# EasyEDA Pro project EVA_RT.eprj, schematic USB_Converter
Board Name: #5_Convertidor; Create Date: 2025-01-23; Page Name: P1; Project Name: EVA_RT; Schematic Name: Convertidor; Update Date: 2025-01-23; Company: EasyEDA.com; Drawed: EasyEDA Pro; Page Size: A4; Part Number: JLCPCB-002; Reviewed: EasyEDA Pro; Version: V0.1
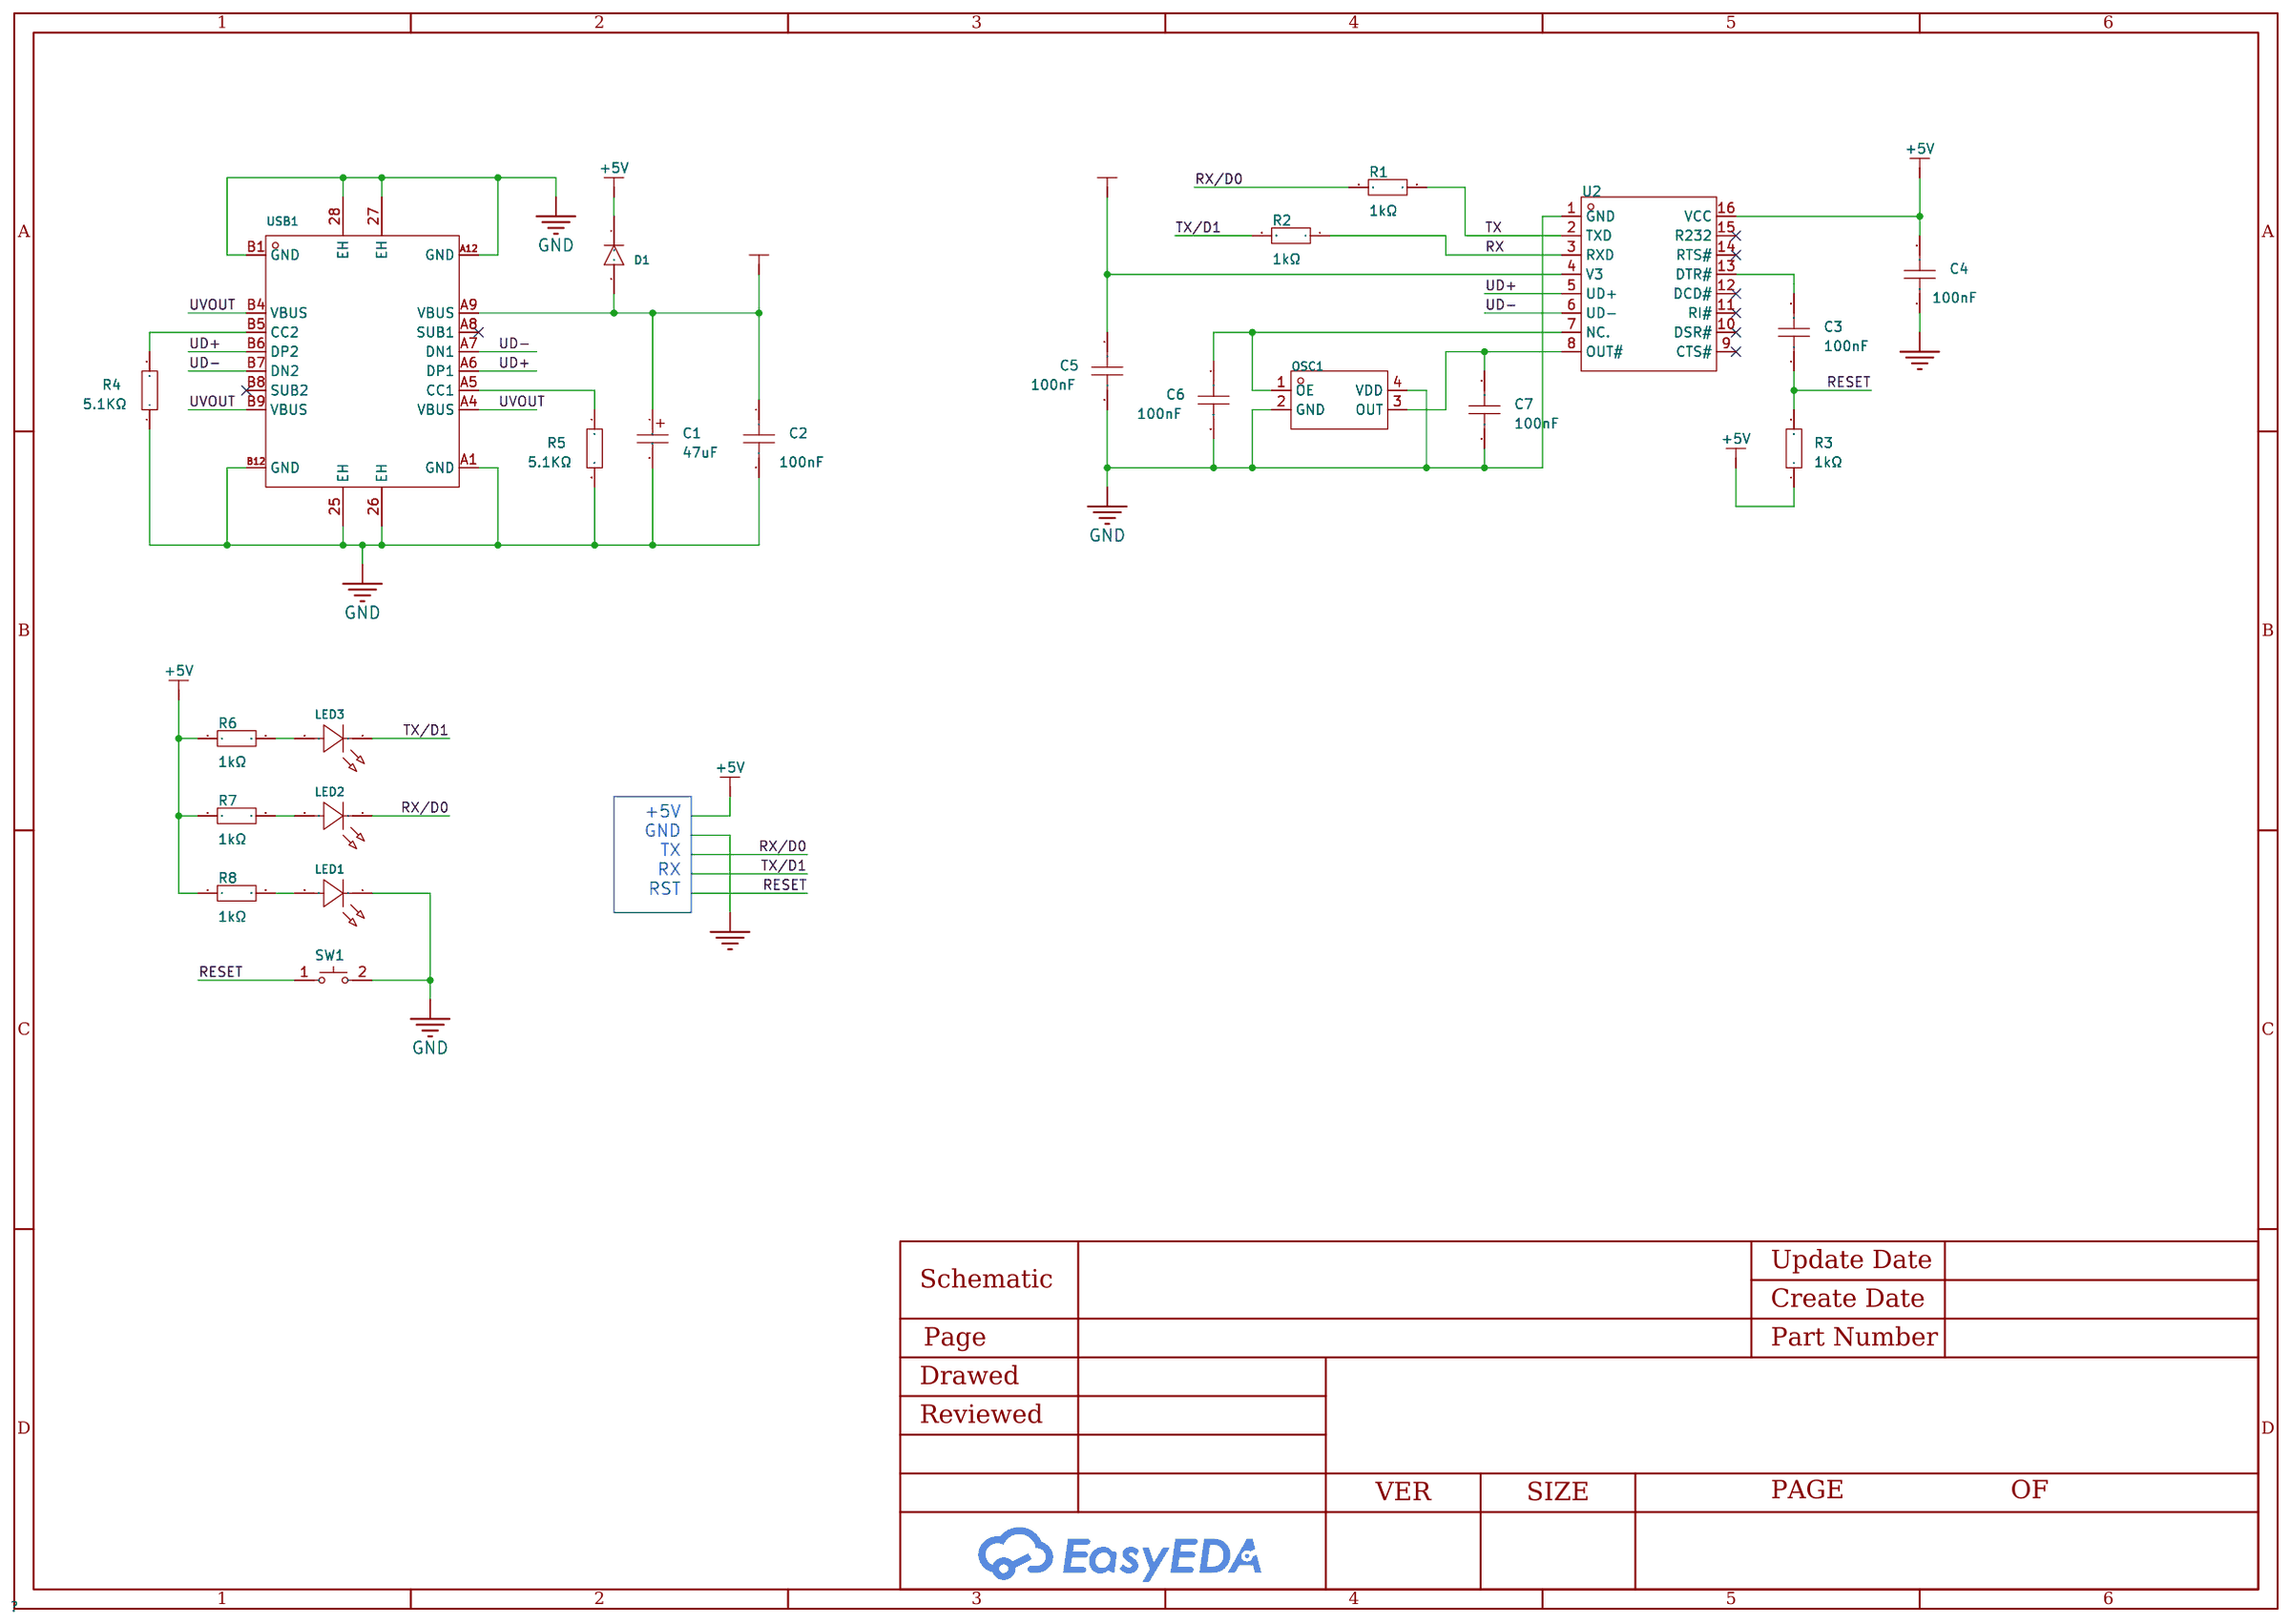
[diagram p1: schematic sheet]

## Parts
C1  47uF  [CAP-SMD_L3.2-W1.6-RD]
C2  100nF  [C0603]
C3  100nF  [C0603]
C4  100nF  [C0603]
C5  100nF  [C0603]
C6  100nF  [C0603]
C7  100nF  [C0603]
D1  SBR0560S1-7  [SOD-123_L2.7-W1.6-LS3.7-RD]
LED1  XL-1608SURC-06  [LED0603-RD_RED]
LED2  XL-1608SURC-06  [LED0603-RD_RED]
LED3  XL-1608SURC-06  [LED0603-RD_RED]
OSC1  DSC6001JI1A-012.0000  [OSC-SMD_4P-L2.5-W2.0-BL-A]
R1  1kΩ  [R0603]
R2  1kΩ  [R0603]
R3  1kΩ  [R0603]
R4  5.1KΩ  [R0603]
R5  5.1KΩ  [R0603]
R6  1kΩ  [R0603]
R7  1kΩ  [R0603]
R8  1kΩ  [R0603]
SW1  TS-1101A-C-R  [SW-SMD_L6.00-W3.60-LS6.0]
U2  CH340C  [SOP-16_L10.0-W3.9-P1.27-LS6.0-BL]
USB1  UB1611-HGN  [USB-C-SMD_GANGYUAN_UB1611-HGN]

## Library data of the parts
C1 = TC212A476K006Y: Capacitance: Tolerance:±10% Tolerance:±10% Rated Voltage: Equivalent Series Resistance(ESR):2.5Ω@100kHz Operating Temperature:-55℃~+125℃ Operating Temperature:-55℃~+125℃; LCSC Part Name: 47uF ±10% 6.3V; Supplier Part: C108525; Manufacturer: Sunlord(顺络); Supplier Footprint: CASE-A-3216; JLCPCB Part Class: Extended Part; Datasheet: https://atta.szlcsc.com/upload/public/pdf/source/20231030/DDA5D10C6B7FCAF98AC7C23C2BD0B0CB.pdf; Supplier: LCSC; Tolerance: ±10%; Equivalent Series Resistance(ESR): 2.5Ω@100kHz; Operating Temperature: -55℃~+125℃
C2-C7 = C1608NP01H101JT000N: Capacitance: Tolerance:±5% Tolerance:±5% Voltage Rated: Temperature Coefficient:; LCSC Part Name: 100pF ±5% 50V; Supplier Part: C343033; Manufacturer: TDK; Supplier Footprint: 0603; JLCPCB Part Class: Extended Part; Datasheet: https://atta.szlcsc.com/upload/public/pdf/source/20190311/C343033_2C1C068BC0A68B1F01ED28762004C2DC.pdf; Supplier: LCSC; Tolerance: ±5%
D1 = SBR0560S1-7: Diode Configuration: Forward Voltage (Vf) @ If:500mV@500mA Reverse Voltage (Vr): Average Rectified Current (Io): Reverse Leakage Current:100uA@60V; LCSC Part Name: 电压:60V 电流:500mA; Supplier Part: C117950; Manufacturer: DIODES(美台); Supplier Footprint: SOD-123; JLCPCB Part Class: Extended Part; Datasheet: https://atta.szlcsc.com/upload/public/pdf/source/20170919/C117950_1505787083539976730.pdf; Supplier: LCSC; Forward Voltage (Vf) @ If: 500mV@500mA; Reverse Leakage Current: 100uA@60V
LED1-LED3 = XL-1608SURC-06: Emitted Color:Red Power Dissipation:55mW Forward Current:25mA Dominant Wavelength:617nm~621nm Dominant Wavelength:617nm~621nm Peak Wavelength:623nm Lens Color:无色透明透镜 Color Temperature:- Color Temperature:- Viewing Angle:120° Mounting Sytle:Positive post O; Supplier Part: C965799; Manufacturer: XINGLIGHT(成兴光); Supplier Footprint: 0603; JLCPCB Part Class: Extended Part; Datasheet: https://atta.szlcsc.com/upload/public/pdf/source/20221102/D860AFDD1CDB02C5A8064103A32707E2.pdf; Supplier: LCSC; Emitted Color: Red; Power Dissipation: 55mW; Forward Current: 25mA; Dominant Wavelength: 617nm~621nm; Peak Wavelength: 623nm; Lens Color: 无色透明透镜; Viewing Angle: 120°; Mounting Sytle: Positive post; Operating Temperature: -30℃~+85℃
OSC1 = DSC6001JI1A-012.0000: Frequency Stability(Full temperature range):±50ppm Frequency Stability(Full temperature range):±50ppm Supply Voltage:1.71V~3.63V Supply Voltage:1.71V~3.63V; LCSC Part Name: ±50ppm 1.71V~3.63V; Supplier Part: C1670141; Manufacturer: MICROCHIP(美国微芯); Supplier Footprint: SMD2520-4P; JLCPCB Part Class: Extended Part; Datasheet: https://atta.szlcsc.com/upload/public/pdf/source/20220204/C2650861_191B97C70369EA2D8C3836A09455016A.pdf; Supplier: LCSC; Frequency Stability(Full temperature range): ±50ppm; Supply Voltage: 1.71V~3.63V
R1-R8 = RC0603FR-071KL: Type:Thick Film Resistors Resistance: Tolerance:±1% Tolerance:±1% Power(Watts): Overload Voltage (Max): Temperature Coefficient:±100ppm/℃ Temperature Coefficient:±100ppm/℃ Operating Temperature Range:-55℃~+155℃ Operating Temperature Range:-55℃~+155℃; LCSC Part Name: 厚膜电阻 1kΩ ±1% 100mW; Supplier Part: C22548; Manufacturer: YAGEO(国巨); Supplier Footprint: 0603; JLCPCB Part Class: Extended Part; Datasheet: https://atta.szlcsc.com/upload/public/pdf/source/20180316/70C0E2BDAE7FCC62C531A5A58D202EE1.pdf; Supplier: LCSC; Type: Thick Film Resistors; Tolerance: ±1%; Temperature Coefficient: ±100ppm/℃; Operating Temperature Range: -55℃~+155℃
SW1 = TS-1101A-C-R: Circuit:SPST Actuator Style:Rectangle button Operating Force:260gf Mounting Style:Standing paste Switch Length:6mm Switch Width:3.6mm Switch Height:2.5mm Strike Gundam:Without Contact Current:50mA Voltage Rating (DC):12V Insulation Resistance:- Actuator/C; LCSC Part Name: 6*3.6*2.5mm 立贴 轻触开关; Supplier Part: C388638; Manufacturer: XKB Connection(中国星坤); Supplier Footprint: SMD; JLCPCB Part Class: Extended Part; Datasheet: https://atta.szlcsc.com/upload/public/pdf/source/20211015/FB820AB85B64273C1A496D9A04A54222.pdf; Supplier: LCSC; Circuit: SPST; Actuator Style: Rectangle button; Operating Force: 260gf; Mounting Style: Standing paste; Switch Length: 6mm; Switch Width: 3.6mm; Switch Height: 2.5mm; Strike Gundam: Without; Contact Current: 50mA; Voltage Rating (DC): 12V; Actuator/Cap Color: Brown; With Lamp: None; Mechanical Life: 100000 Times; Operating Temperature: -30℃~+85℃
U2 = CH340C_C7464026: LCSC Part Name: CH340C （SMT编带）人工转编带; Supplier Part: C7464026; Manufacturer: WCH(南京沁恒); Supplier Footprint: SOP-16; JLCPCB Part Class: Extended Part; Datasheet: https://atta.szlcsc.com/upload/public/pdf/source/20230530/6E401E9554E9F5311886CC8B3F89B62E.pdf; Supplier: LCSC
USB1 = UB1611-HGN: Connector Type:Type-C Standard:- Gender:Female Number of Ports:1 Number of Contacts:16P Mounting Style:卧贴 Current Rating - Power (Max):- Contact Material:- Contact Plating:- Operating Temperature Range:-30℃~+85℃ Operating Temperature Range:-30℃~+85℃ Solde; LCSC Part Name: Type-C 母 卧贴; Supplier Part: C2831450; Manufacturer: GANGYUAN(港源); Supplier Footprint: SMD; JLCPCB Part Class: Extended Part; Datasheet: https://atta.szlcsc.com/upload/public/pdf/source/20210519/C2831450_F247DF5FDE6A7D7DE05B800B10D8EC4F.pdf; Supplier: LCSC; Connector Type: Type-C; Gender: Female; Number of Ports: 1; Number of Contacts: 16P; Mounting Style: 卧贴; Operating Temperature Range: -30℃~+85℃

## Nets
+3.3V: C5.1 U2.4(V3)
+5V: C4.2 D1.1(C) R3.1 R6.1 R7.1 R8.1 U2.16(VCC)
+5VU: C1.1 C2.1 D1.2(A) USB1.A9(VBUS)
GND: C1.2 C2.2 C4.1 C5.2 C6.2 C7.1 LED1.1(K) OSC1.2(GND) OSC1.4(VDD) R4.1 R5.2 SW1.2 U2.1(GND) USB1.25(EH) USB1.26(EH) USB1.27(EH) USB1.28(EH) USB1.A1(GND) USB1.A12(GND) USB1.B1(GND) USB1.B12(GND)
RESET: C3.1 R3.2 SW1.1
RX: R2.1 U2.3(RXD)
RX/D0: LED2.1(K) R1.2
TX: R1.1 U2.2(TXD)
TX/D1: LED3.1(K) R2.2
UD+: U2.5(UD+) USB1.A6(DP1) USB1.B6(DP2)
UD-: U2.6(UD-) USB1.A7(DN1) USB1.B7(DN2)
UVOUT: USB1.A4(VBUS) USB1.B4(VBUS) USB1.B9(VBUS)
$C3_2: C3.2 U2.13(DTR#)
$C6_1: C6.1 OSC1.1(OE) U2.7(NC.)
$C7_2: C7.2 OSC1.3(OUT) U2.8(OUT#)
$LED1_2: LED1.2(A) R8.2
$LED2_2: LED2.2(A) R7.2
$LED3_2: LED3.2(A) R6.2
$R4_2: R4.2 USB1.B5(CC2)
$R5_1: R5.1 USB1.A5(CC1)

Not connected (* = marked no-connect by the designer): U2 9(CTS#)* 10(DSR#)* 11(RI#)* 12(DCD#)* 14(RTS#)* 15(R232)*; USB1 A8(SUB1)* B8(SUB2)*

## Notes on the sheet
- +5V
- GND
- TX
- RX
- RST
